# Altium schematic sheet DSP-Sheet-2.SchDoc
size A4; SheetNumber: 5; SheetTotal: 8
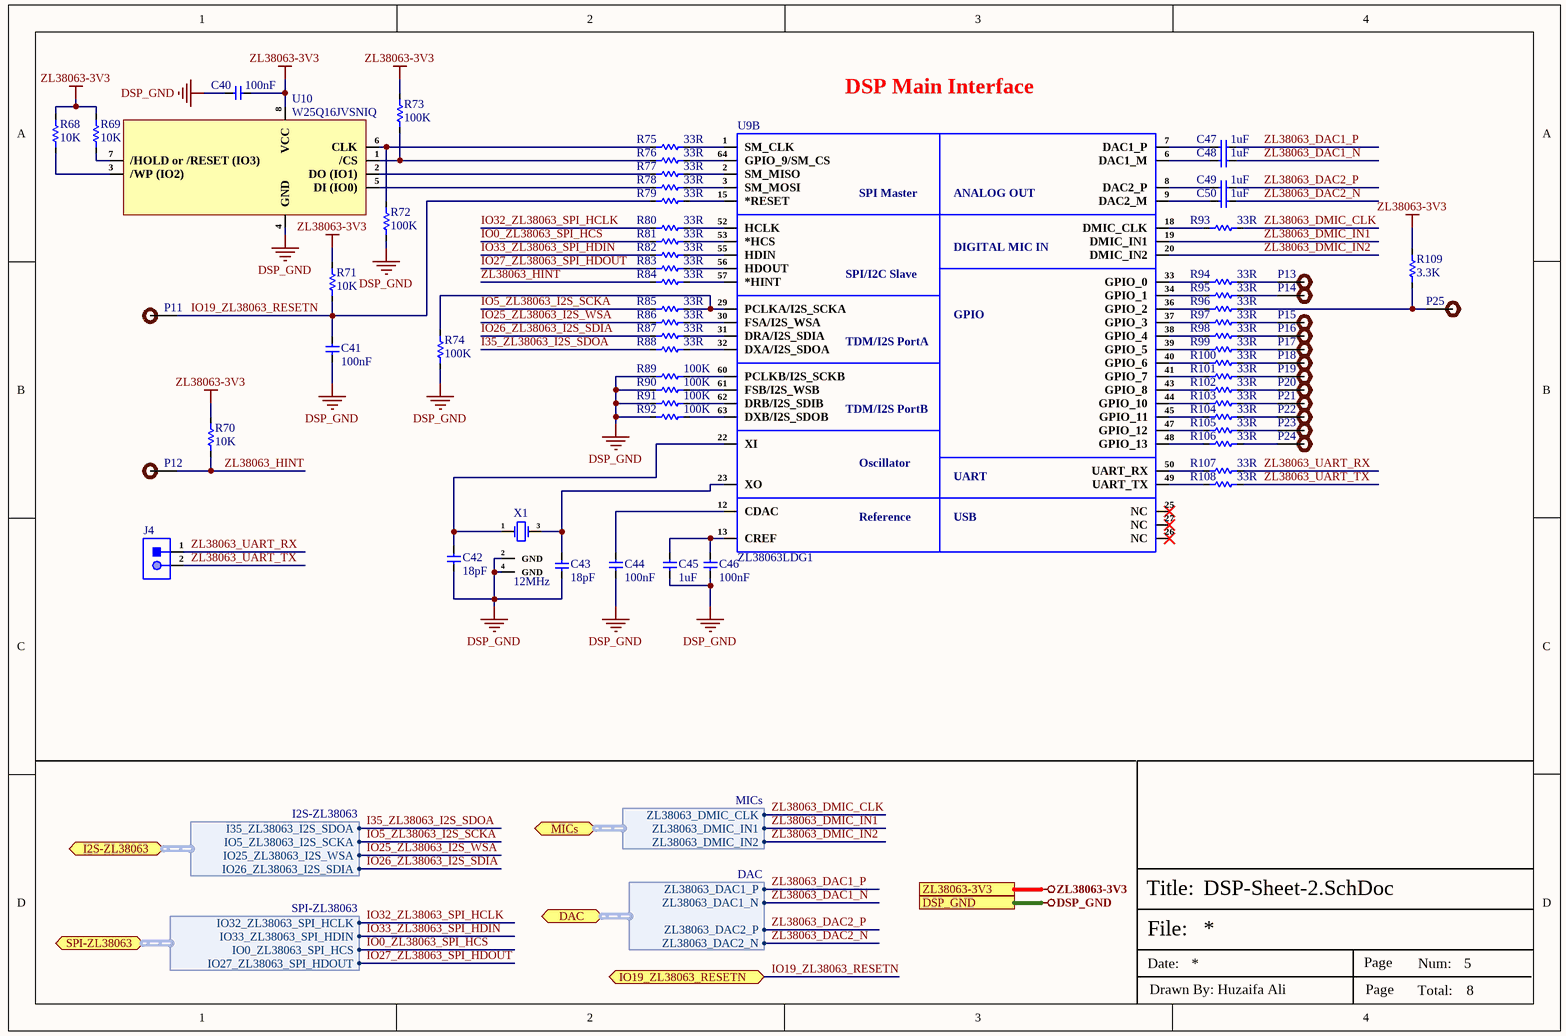
[diagram p0: DSP-Sheet-2.SchDoc]

## Parts
C40  100nF  [Cap-0402]
C41  100nF  [Cap-0402]
C42  18pF  [Cap-0603]
C43  18pF  [Cap-0603]
C44  100nF  [Cap-0402]
C45  1uF  [Cap-0402]
C46  100nF  [Cap-0402]
C47  1uF  [Cap-0402]
C48  1uF  [Cap-0402]
C49  1uF  [Cap-0402]
C50  1uF  [Cap-0402]
J4  X6511WV-02H-C60D30  [HDR1X2_]  (value not drawn)
P11  TEST POINT  [Test-point]  (value not drawn)
P12  TEST POINT  [Test-point]  (value not drawn)
P13  TEST POINT  [Test-point]  (value not drawn)
P14  TEST POINT  [Test-point]  (value not drawn)
P15  TEST POINT  [Test-point]  (value not drawn)
P16  TEST POINT  [Test-point]  (value not drawn)
P17  TEST POINT  [Test-point]  (value not drawn)
P18  TEST POINT  [Test-point]  (value not drawn)
P19  TEST POINT  [Test-point]  (value not drawn)
P20  TEST POINT  [Test-point]  (value not drawn)
P21  TEST POINT  [Test-point]  (value not drawn)
P22  TEST POINT  [Test-point]  (value not drawn)
P23  TEST POINT  [Test-point]  (value not drawn)
P24  TEST POINT  [Test-point]  (value not drawn)
P25  TEST POINT  [Test-point]  (value not drawn)
R68  10K  [Res-0402]
R69  10K  [Res-0402]
R70  10K  [Res-0402]
R71  10K  [Res-0402]
R72  100K  [Res-0402]
R73  100K  [Res-0402]
R74  100K  [Res-0402]
R75  33R  [Res-0201]
R76  33R  [Res-0201]
R77  33R  [Res-0201]
R78  33R  [Res-0201]
R79  33R  [Res-0201]
R80  33R  [Res-0201]
R81  33R  [Res-0201]
R82  33R  [Res-0201]
R83  33R  [Res-0201]
R84  33R  [Res-0201]
R85  33R  [Res-0201]
R86  33R  [Res-0201]
R87  33R  [Res-0201]
R88  33R  [Res-0201]
R89  100K  [Res-0402]
R90  100K  [Res-0402]
R91  100K  [Res-0402]
R92  100K  [Res-0402]
R93  33R  [Res-0201]
R94  33R  [Res-0201]
R95  33R  [Res-0201]
R96  33R  [Res-0201]
R97  33R  [Res-0201]
R98  33R  [Res-0201]
R99  33R  [Res-0201]
R100  33R  [Res-0201]
R101  33R  [Res-0201]
R102  33R  [Res-0201]
R103  33R  [Res-0201]
R104  33R  [Res-0201]
R105  33R  [Res-0201]
R106  33R  [Res-0201]
R107  33R  [Res-0201]
R108  33R  [Res-0201]
R109  3.3K  [Res-0201]
U9  ZL38063LDG1  [QFN-64-EP(9x9)]  (part B of 2)
U10  W25Q16JVSNIQ  [SOP-8]
X1  12MHz  [SMD2520-4P]

## Ports
DAC (bidir, harness DAC, see Amplifier-Sheet[1D], Buttons-LED-Sheet[1D]), DSP_GND (see DSP-Sheet-1[3D], Power-Sheet[2D]), I2S-ZL38063 (bidir, harness I2S-ZL38063, see Controller-Sheet[1D]), IO19_ZL38063_RESETN (bidir, see Controller-Sheet[3D]), MICs (bidir, harness MICs, see MICs-Sheet[1D]), SPI-ZL38063 (bidir, harness SPI-ZL38063, see Controller-Sheet[1D]), ZL38063-3V3 (see DSP-Sheet-1[3D], MICs-Sheet[3D], Power-Sheet[2D])

## Harnesses
I2S-ZL38063: I35_ZL38063_I2S_SDOA, IO5_ZL38063_I2S_SCKA, IO25_ZL38063_I2S_WSA, IO26_ZL38063_I2S_SDIA
SPI-ZL38063: IO32_ZL38063_SPI_HCLK, IO33_ZL38063_SPI_HDIN, IO0_ZL38063_SPI_HCS, IO27_ZL38063_SPI_HDOUT
MICs: ZL38063_DMIC_CLK, ZL38063_DMIC_IN1, ZL38063_DMIC_IN2
DAC: ZL38063_DAC1_P, ZL38063_DAC1_N, ZL38063_DAC2_P, ZL38063_DAC2_N

## Nets
DSP_GND: C40.2 C41.2 C42.1 C43.1 C44.2 C45.2 C46.2 R72.1 R74.1 R89.2 R90.2 R91.2 R92.2 U10.4(GND) X1.2(GND) X1.4(GND) ; port DSP_GND
ZL38063-3V3: C40.1 R68.2 R69.2 R70.2 R71.2 R73.2 R109.2 U10.8(VCC) ; port ZL38063-3V3
I35_ZL38063_I2S_SDOA: R88.1 ; port I2S-ZL38063.I35_ZL38063_I2S_SDOA
IO0_ZL38063_SPI_HCS: R81.1 ; port SPI-ZL38063.IO0_ZL38063_SPI_HCS
IO5_ZL38063_I2S_SCKA: R85.1 ; port I2S-ZL38063.IO5_ZL38063_I2S_SCKA
IO19_ZL38063_RESETN: C41.1 P11.1 R71.1 R79.1 ; port IO19_ZL38063_RESETN
IO25_ZL38063_I2S_WSA: R86.1 ; port I2S-ZL38063.IO25_ZL38063_I2S_WSA
IO26_ZL38063_I2S_SDIA: R87.1 ; port I2S-ZL38063.IO26_ZL38063_I2S_SDIA
IO27_ZL38063_SPI_HDOUT: R83.1 ; port SPI-ZL38063.IO27_ZL38063_SPI_HDOUT
IO32_ZL38063_SPI_HCLK: R80.1 ; port SPI-ZL38063.IO32_ZL38063_SPI_HCLK
IO33_ZL38063_SPI_HDIN: R82.1 ; port SPI-ZL38063.IO33_ZL38063_SPI_HDIN
ZL38063_DAC1_N: C48.1 ; port DAC.ZL38063_DAC1_N
ZL38063_DAC1_P: C47.1 ; port DAC.ZL38063_DAC1_P
ZL38063_DAC2_N: C50.1 ; port DAC.ZL38063_DAC2_N
ZL38063_DAC2_P: C49.1 ; port DAC.ZL38063_DAC2_P
ZL38063_DMIC_CLK: R93.2 ; port MICs.ZL38063_DMIC_CLK
ZL38063_DMIC_IN1: U9.19(DMIC_IN1) ; port MICs.ZL38063_DMIC_IN1
ZL38063_DMIC_IN2: U9.20(DMIC_IN2) ; port MICs.ZL38063_DMIC_IN2
ZL38063_HINT: P12.1 R70.1 R84.1
ZL38063_UART_RX: J4.1 R107.2
ZL38063_UART_TX: J4.2 R108.2
NetC42_2: C42.2 U9.22(XI) X1.1(OSC1)
NetC43_2: C43.2 U9.23(XO) X1.3(OSC2)
NetC44_1: C44.1 U9.12(CDAC)
NetC45_1: C45.1 C46.1 U9.13(CREF)
NetC47_2: C47.2 U9.7(DAC1_P)
NetC48_2: C48.2 U9.6(DAC1_M)
NetC49_2: C49.2 U9.8(DAC2_P)
NetC50_2: C50.2 U9.9(DAC2_M)
NetP13_1: P13.1 R94.2
NetP14_1: P14.1 R95.2
NetP15_1: P15.1 R97.2
NetP16_1: P16.1 R98.2
NetP17_1: P17.1 R99.2
NetP18_1: P18.1 R100.2
NetP19_1: P19.1 R101.2
NetP20_1: P20.1 R102.2
NetP21_1: P21.1 R103.2
NetP22_1: P22.1 R104.2
NetP23_1: P23.1 R105.2
NetP24_1: P24.1 R106.2
NetP25_1: P25.1 R96.2 R109.1
NetR68_1: R68.1 U10.3(/WP_(IO2))
NetR69_1: R69.1 U10.7(/HOLD_or_/RESET_(IO3))
NetR72_2: R72.2 R75.1 U10.6(CLK)
NetR73_1: R73.1 R76.1 U10.1(/CS)
NetR74_2: R74.2 R85.2 U9.29(PCLKA/I2S_SCKA)
NetR75_2: R75.2 U9.1(SM_CLK)
NetR76_2: R76.2 U9.64(GPIO_9/SM_CS)
NetR77_1: R77.1 U10.2(DO_(IO1))
NetR77_2: R77.2 U9.2(SM_MISO)
NetR78_1: R78.1 U10.5(DI_(IO0))
NetR78_2: R78.2 U9.3(SM_MOSI)
NetR79_2: R79.2 U9.15(*RESET)
NetR80_2: R80.2 U9.52(HCLK)
NetR81_2: R81.2 U9.53(*HCS)
NetR82_2: R82.2 U9.55(HDIN)
NetR83_2: R83.2 U9.56(HDOUT)
NetR84_2: R84.2 U9.57(*HINT)
NetR86_2: R86.2 U9.30(FSA/I2S_WSA)
NetR87_2: R87.2 U9.31(DRA/I2S_SDIA)
NetR88_2: R88.2 U9.32(DXA/I2S_SDOA)
NetR89_1: R89.1 U9.60(PCLKB/I2S_SCKB)
NetR90_1: R90.1 U9.61(FSB/I2S_WSB)
NetR91_1: R91.1 U9.62(DRB/I2S_SDIB)
NetR92_1: R92.1 U9.63(DXB/I2S_SDOB)
NetR93_1: R93.1 U9.18(DMIC_CLK)
NetR94_1: R94.1 U9.33(GPIO_0)
NetR95_1: R95.1 U9.34(GPIO_1)
NetR96_1: R96.1 U9.36(GPIO_2)
NetR97_1: R97.1 U9.37(GPIO_3)
NetR98_1: R98.1 U9.38(GPIO_4)
NetR99_1: R99.1 U9.39(GPIO_5)
NetR100_1: R100.1 U9.40(GPIO_6)
NetR101_1: R101.1 U9.41(GPIO_7)
NetR102_1: R102.1 U9.43(GPIO_8)
NetR103_1: R103.1 U9.44(GPIO_10)
NetR104_1: R104.1 U9.45(GPIO_11)
NetR105_1: R105.1 U9.47(GPIO_12)
NetR106_1: R106.1 U9.48(GPIO_13)
NetR107_1: R107.1 U9.50(UART_RX)
NetR108_1: R108.1 U9.49(UART_TX)

Not connected (* = marked no-connect by the designer): U9 25(NC)* 26(NC)* 27(NC)*

## Notes on the sheet
- (near U9) DSP Main Interface
- File:
- Title:
- Date:
- Page
- Num:
- Total:
- Drawn By: Huzaifa Ali
- (in symbol ZL38063LDG1, part B) SPI Master; ANALOG OUT; DIGITAL MIC IN; SPI/I2C Slave; GPIO; TDM/I2S PortA; TDM/I2S PortB; Oscillator; UART; Reference; USB

## Library data of the parts
C40 C41 C44 C46 = CC0402KRX5R7BB104: CAP CER 0.1UF 16V X5R 0402; Manufacturer: Yageo; Tolerance: 10%; Supplier 1: Mouser; Manufacturer Part Number: CC0402KRX5R7BB104; RoHS: Yes; Category: Ceramic Capacitors; Stock 1: 936792; Pricing 1: 1=0.10000, 10=0.02300, 50=0.02300, 100=0.01100, 1000=0.00600, 10000=0.00400 (USD); Mount: Surface Mount; Case/Package: 0402; Number of Pins: 2; Case Code (Metric): 1005; Case Code (Imperial): 0402; Min Operating Temperature: -55°C; Max Operating Temperature: 85°C; Capacitance: 100nF; Dielectric: X5R; Packaging: Tape and Reel; Voltage Rating: 16V; Package Quantity: 1; Voltage Rating (DC): 16V; Termination: SMD/SMT; Resistor Type: Ceramic; Series: CC; Construction: Flat; Length: 1mm; Width: 0.02inch; Height: 0.5mm; Thickness: 0.022inch; Depth: 0.5mm; Radiation Hardening: No; REACH SVHC: Unknown; Lead Free: Lead Free; Halogen Free: Halogen Free; RoHS Compliant: Yes; ComponentLink1URL: https://datasheet.ciiva.com/155/mlccorderingcode-155879.pdf?src-supplier=Digi-Key; ComponentLink1Description: https://datasheet.ciiva.com/155/mlccorderingcode-155879.pdf?src-supplier=Digi-Key; ComponentLink2URL: https://datasheet.ciiva.com/155/mlccorderingcode-155878.pdf?src-supplier=Digi-Key; ComponentLink2Description: https://datasheet.ciiva.com/155/mlccorderingcode-155878.pdf?src-supplier=Digi-Key; ComponentLink3URL: https://datasheet.ciiva.com/155/mlccorderingcode-155880.pdf?src-supplier=Digi-Key; ComponentLink3Description: https://datasheet.ciiva.com/155/mlccorderingcode-155880.pdf?src-supplier=Digi-Key; ComponentLink4URL: https://datasheet.ciiva.com/11464/upy-gphc-x5r-4v-to-50v-12-11464869.pdf?src-supplier=Avnet; ComponentLink4Description: https://datasheet.ciiva.com/11464/upy-gphc-x5r-4v-to-50v-12-11464869.pdf?src-supplier=Avnet; Supplier Part Number 1: 603-CC402KRX5R7BB104; LCSC Part Number: C106204
C42 C43 = CC0603JRNPO9BN180: CAP CER 18PF 50V C0G/NPO 0603; Manufacturer: Yageo; Tolerance: 5%; Dielectric: C0G; Temperature Coefficient: 30ppm/°C; Insulation Resistance: 100GR; Supplier 1: Digi-Key; Manufacturer Part Number: CC0603JRNPO9BN180; RoHS: Yes; Category: Ceramic Capacitors; Stock 1: 936645; Pricing 1: 1=0.10000, 10=0.04000, 50=0.02200, 100=0.01790, 500=0.01282, 1000=0.01007 (USD); Mount: Surface Mount; Case/Package: 0603; Number of Pins: 2; Case Code (Metric): 1608; Case Code (Imperial): 0603; Min Operating Temperature: -55°C; Max Operating Temperature: 125°C; Capacitance: 18pF; Packaging: Tape and Reel; Voltage Rating: 50V; Voltage Rating (DC): 50V; Package Quantity: 1; Termination: SMD/SMT; Resistor Type: Ceramic; Series: CC; Length: 1.6mm; Width: 0.031inch; Height: 0.8mm; Thickness: 0.035inch; Depth: 0.8mm; Radiation Hardening: No; REACH SVHC: No SVHC; Lead Free: Lead Free; RoHS Compliant: Yes; ComponentLink1URL: https://datasheet.ciiva.com/144/mlccorderingcode-144638.pdf?src-supplier=Digi-Key; ComponentLink1Description: https://datasheet.ciiva.com/144/mlccorderingcode-144638.pdf?src-supplier=Digi-Key; ComponentLink2URL: https://datasheet.ciiva.com/144/mlccorderingcode-144637.pdf?src-supplier=Digi-Key; ComponentLink2Description: https://datasheet.ciiva.com/144/mlccorderingcode-144637.pdf?src-supplier=Digi-Key; ComponentLink3URL: https://datasheet.ciiva.com/144/mlccorderingcode-144639.pdf?src-supplier=Digi-Key; ComponentLink3Description: https://datasheet.ciiva.com/144/mlccorderingcode-144639.pdf?src-supplier=Digi-Key; ComponentLink4URL: https://datasheet.ciiva.com/28450/1443161-28450477.pdf?src-supplier=Element14; ComponentLink4Description: https://datasheet.ciiva.com/28450/1443161-28450477.pdf?src-supplier=Element14; ComponentLink5URL: https://datasheet.ciiva.com/46430/1835847-46430152.pdf?src-supplier=Element14; ComponentLink5Description: https://datasheet.ciiva.com/46430/1835847-46430152.pdf?src-supplier=Element14; ComponentLink6URL: https://datasheet.ciiva.com/5425/upy-gp-np0-16v-to-50v-8-5425439.pdf?src-supplier=Mouser; ComponentLink6Description: https://datasheet.ciiva.com/5425/upy-gp-np0-16v-to-50v-8-5425439.pdf?src-supplier=Mouser; ComponentLink7URL: https://datasheet.ciiva.com/8033/1734582-8033733.pdf?src-supplier=Element14; ComponentLink7Description: https://datasheet.ciiva.com/8033/1734582-8033733.pdf?src-supplier=Element14; ComponentLink8URL: https://datasheet.ciiva.com/11587/upy-gp-np0-16v-to-50v-8-11587323.pdf?src-supplier=Avnet; ComponentLink8Description: https://datasheet.ciiva.com/11587/upy-gp-np0-16v-to-50v-8-11587323.pdf?src-supplier=Avnet; Supplier Part Number 1: 311-1061-6-ND; LCSC Part Number: C107040
C45 C47-C50 = CC0402KRX5R8BB105: CAP CER 1UF 25V X5R 0402; Manufacturer: Yageo; Tolerance: 10%; Supplier 1: Mouser; Manufacturer Part Number: CC0402KRX5R8BB105; RoHS: Yes; Category: Ceramic Capacitors; Stock 1: 91975; Pricing 1: 1=0.30000, 10=0.20400, 50=0.20400, 100=0.11600, 1000=0.07200, 10000=0.05900 (USD); Mount: Surface Mount; Case/Package: 0402; Case Code (Metric): 1005; Case Code (Imperial): 0402; Weight: 2.3E-05oz; Min Operating Temperature: -55°C; Max Operating Temperature: 85°C; Packaging: Tape and Reel; Capacitance: 1uF; Voltage Rating: 25V; Dielectric: X5R; Termination: SMD/SMT; Voltage Rating (DC): 25V; Package Quantity: 10000; Length: 0.039inch; Width: 0.02inch; Thickness: 0.022inch; Lead Free: Lead Free; Halogen Free: Halogen Free; RoHS Compliant: Yes; ComponentLink1URL: http://www.mouser.com/ds/2/447/Yageo_UPY-GP_NP0_16V-to-50V_9-358835.pdf?src-supplier=Mouser; ComponentLink1Description: http://www.mouser.com/ds/2/447/Yageo_UPY-GP_NP0_16V-to-50V_9-358835.pdf?src-supplier=Mouser; ComponentLink2URL: http://www.yageo.com/documents/recent/UPY-GPHC_X5R_4V-to-50V_25.pdf?src-supplier=Digi-Key; ComponentLink2Description: http://www.yageo.com/documents/recent/UPY-GPHC_X5R_4V-to-50V_25.pdf?src-supplier=Digi-Key; ComponentLink3URL: https://4donline.ihs.com/images/VipMasterIC/IC/YAGO/YAGO-S-A0006851646/YAGO-S-A0006851646-1.pdf?hkey=6D3A4C79FDBF58556ACFDE234799DDF0&src-supplier=Newark; ComponentLink3Description: https://4donline.ihs.com/images/VipMasterIC/IC/YAGO/YAGO-S-A0006851646/YAGO-S-A0006851646-1.pdf?hkey=6D3A4C79FDBF58556ACFDE234799DDF0&src-supplier=Newark; Supplier Part Number 1: 603-CC402KRX5R8BB105; LCSC Part Number: C326568
J4 = X6511WV-02H-C60D30: Gold 250V 3A Straight Square Pins 2.5mm 2P 260℃ 6mm -40℃~+105℃ 3mm 2.54mm Plugin Black Brass 1x2P Plugin,P=2.54mm Pin Headers ROHS; Manufacturer: XKB; Item Type: Male Header; Manufacturer Part Number: X6511WV-02H-C60D30; Package: Plugin,P=2.54mm; LCSC Part Number: C706874; ComponentLink1Description: LCSC; ComponentLink1URL: https://www.lcsc.com/product-detail/Pin-Headers_XKB-Connectivity-X6511WV-02H-C60D30_C706874.html
P11-P25 = TEST POINT: Test Point ON; Item Type: TEST POINT
R68-R71 = RC0402FR-0710KL: RES 10K OHM 1% 1/16W 0402; Manufacturer: Yageo; Resistance: 10kR; Voltage Rating (DC): 50V; Temperature Coefficient: 100ppm/°C; Power Rating: 62.5mW; Max Power Dissipation: 63mW; Item Type: Resistor; Supplier 1: Mouser; Manufacturer Part Number: RC0402FR-0710KL; RoHS: Yes; Category: Chip SMD Resistors; Stock 1: 18648329; Pricing 1: 1=0.10000, 10=0.01400, 50=0.01400, 100=0.00500, 1000=0.00300, 10000=0.00200 (USD); Case/Package: 0402; Number of Pins: 2; Case Code (Imperial): 0402; Case Code (Metric): 1005; Min Operating Temperature: -55°C; Max Operating Temperature: 155°C; Resistor Type: Thick Film; Tolerance: 1%; Packaging: Tape and Reel; Voltage Rating: 50V; Termination: SMD/SMT; Working Voltage: 50V; Number of Terminations: 2; Features: Moisture Resistant; Series: RC; Resistance Tolerance: 1%; Construction: Rectangular; Length: 1mm; Width: 0.5mm; Height: 0.32mm; Depth: 0.5mm; Lead Pitch: 0.2mm; REACH SVHC: No SVHC; Lead Free: Lead Free; RoHS Compliant: Yes; Military Standard: Not; ComponentLink1URL: https://datasheet.ciiva.com/7660/38568-7660787.pdf?src-supplier=Element14; ComponentLink1Description: https://datasheet.ciiva.com/7660/38568-7660787.pdf?src-supplier=Element14; ComponentLink2URL: https://datasheet.ciiva.com/7849/1686128-7849814.pdf?src-supplier=Element14; ComponentLink2Description: https://datasheet.ciiva.com/7849/1686128-7849814.pdf?src-supplier=Element14; ComponentLink3URL: https://datasheet.ciiva.com/7983/1018594-7983486.pdf?src-supplier=Element14; ComponentLink3Description: https://datasheet.ciiva.com/7983/1018594-7983486.pdf?src-supplier=Element14; ComponentLink4URL: https://datasheet.ciiva.com/22747/1018594-22747512.pdf?src-supplier=Element14; ComponentLink4Description: https://datasheet.ciiva.com/22747/1018594-22747512.pdf?src-supplier=Element14; ComponentLink5URL: https://datasheet.ciiva.com/12667/pyu-rc0402-51-rohs-l-6-r-12667067.pdf?src-supplier=Mouser; ComponentLink5Description: https://datasheet.ciiva.com/12667/pyu-rc0402-51-rohs-l-6-r-12667067.pdf?src-supplier=Mouser; ComponentLink6URL: https://datasheet.ciiva.com/7849/1784430-7849813.pdf?src-supplier=Element14; ComponentLink6Description: https://datasheet.ciiva.com/7849/1784430-7849813.pdf?src-supplier=Element14; ComponentLink7URL: https://datasheet.ciiva.com/7849/1784430-7849815.pdf?src-supplier=Element14; ComponentLink7Description: https://datasheet.ciiva.com/7849/1784430-7849815.pdf?src-supplier=Element14; Supplier Part Number 1: 603-RC0402FR-0710KL; LCSC Part Number: C60490
R72-R74 R89-R92 = RC0402FR-07100KL: RES 100K OHM 1% 1/16W 0402; Manufacturer: Yageo; Resistance: 100kR; Temperature Coefficient: 100ppm/°C; Power Rating: 63mW; Voltage Rating: 50V; Item Type: Resistor; Supplier 1: Mouser; Manufacturer Part Number: RC0402FR-07100KL; RoHS: Yes; Category: Chip SMD Resistors; Stock 1: 7759549; Pricing 1: 1=0.10000, 10=0.01200, 50=0.01200, 100=0.00500, 1000=0.00300, 2500=0.00200, 10000=0.00100 (USD); Case/Package: 0402; Case Code (Metric): 1005; Case Code (Imperial): 0402; Min Operating Temperature: -55°C; Max Operating Temperature: 155°C; Resistor Type: Thick Film; Tolerance: 1%; Packaging: Tape and Reel; Package Quantity: 1; Number of Terminations: 2; Termination: SMD/SMT; Max Power Dissipation: 63mW; Working Voltage: 50V; Features: Moisture Resistant; Series: RC; Resistance Tolerance: 1%; Construction: Rectangular; Technology: THICK FILM; Length: 0.039inch; Width: 0.02inch; Height: 0.016inch; Depth: 0.5mm; REACH SVHC: No SVHC; Lead Free: Lead Free; RoHS Compliant: Yes; Military Standard: Not; ComponentLink1URL: https://datasheet.ciiva.com/11819/0900766b80c66297-11819452.pdf?src-supplier=RSComponents; ComponentLink1Description: https://datasheet.ciiva.com/11819/0900766b80c66297-11819452.pdf?src-supplier=RSComponents; ComponentLink2URL: https://datasheet.ciiva.com/22747/1018594-22747509.pdf?src-supplier=Element14; ComponentLink2Description: https://datasheet.ciiva.com/22747/1018594-22747509.pdf?src-supplier=Element14; ComponentLink3URL: https://datasheet.ciiva.com/2453/pyu-r-int-thick-7-2453362.pdf?src-supplier=Digi-Key; ComponentLink3Description: https://datasheet.ciiva.com/2453/pyu-r-int-thick-7-2453362.pdf?src-supplier=Digi-Key; ComponentLink4URL: https://datasheet.ciiva.com/2453/pyu-r-int-thick-7-2453363.pdf?src-supplier=Digi-Key; ComponentLink4Description: https://datasheet.ciiva.com/2453/pyu-r-int-thick-7-2453363.pdf?src-supplier=Digi-Key; ComponentLink5URL: https://datasheet.ciiva.com/2453/pyu-r-int-thick-7-2453361.pdf?src-supplier=Digi-Key; ComponentLink5Description: https://datasheet.ciiva.com/2453/pyu-r-int-thick-7-2453361.pdf?src-supplier=Digi-Key; ComponentLink6URL: https://datasheet.ciiva.com/12667/pyu-rc0402-51-rohs-l-6-r-12667930.pdf?src-supplier=Mouser; ComponentLink6Description: https://datasheet.ciiva.com/12667/pyu-rc0402-51-rohs-l-6-r-12667930.pdf?src-supplier=Mouser; ComponentLink7URL: https://datasheet.ciiva.com/15189/getdatasheetpartid-323696-15189334.pdf?src-supplier=Verical; ComponentLink7Description: https://datasheet.ciiva.com/15189/getdatasheetpartid-323696-15189334.pdf?src-supplier=Verical; Supplier Part Number 1: 603-RC0402FR-07100KL; LCSC Part Number: C60491
R75-R88 R93-R108 = RC0201FR-0733RL: RES 33 OHM 1% 1/20W 0201; Manufacturer: Yageo; Item Type: Resistor; Supplier: Future Electronics; Supplier Part Number: 6199285; Manufacturer Part Number: RC0201FR-0733RL; RoHS: Yes; Category: Chip SMD Resistors; Stock: 1420000; Pricing: 10000=0.0013, 50000=0.0012, 250000=0.0012, 750000=0.0011, 2000000=0.001 (USD); ComponentLink1URL: https://datasheet.ciiva.com/2560/pyu-r-int-thick-7-2560877.pdf?src-supplier=Digi-Key; ComponentLink1Description: https://datasheet.ciiva.com/2560/pyu-r-int-thick-7-2560877.pdf?src-supplier=Digi-Key; ComponentLink2URL: https://datasheet.ciiva.com/2560/pyu-r-int-thick-7-2560878.pdf?src-supplier=Digi-Key; ComponentLink2Description: https://datasheet.ciiva.com/2560/pyu-r-int-thick-7-2560878.pdf?src-supplier=Digi-Key; ComponentLink3URL: https://datasheet.ciiva.com/2560/pyu-r-int-thick-7-2560879.pdf?src-supplier=Digi-Key; ComponentLink3Description: https://datasheet.ciiva.com/2560/pyu-r-int-thick-7-2560879.pdf?src-supplier=Digi-Key; ComponentLink4URL: https://datasheet.ciiva.com/7672/1563626-7672223.pdf?src-supplier=Element14; ComponentLink4Description: https://datasheet.ciiva.com/7672/1563626-7672223.pdf?src-supplier=Element14; ComponentLink5URL: https://datasheet.ciiva.com/22698/1563626-22698520.pdf?src-supplier=Element14; ComponentLink5Description: https://datasheet.ciiva.com/22698/1563626-22698520.pdf?src-supplier=Element14; LCSC Part Number: C295794
R109 = RC0201FR-073K3L: RES 3.3K OHM 1% 1/20W 0201; Manufacturer: Yageo; Item Type: Resistor; Supplier: Future Electronics; Supplier Part Number: 1068525; Manufacturer Part Number: RC0201FR-073K3L; RoHS: Yes; Category: Chip SMD Resistors; Stock: 40000; Pricing: 10000=0.0009, 50000=0.0013, 100000=0.0008, 250000=0.0013, 400000=0.0008, 750000=0.0012, 1500000=0.0007, 2000000=0.0011, 5000000=0.0007 (USD); ComponentLink1URL: https://datasheet.ciiva.com/14985/pyu-r-int-thick-7-14985418.pdf?src-supplier=Digi-Key; ComponentLink1Description: https://datasheet.ciiva.com/14985/pyu-r-int-thick-7-14985418.pdf?src-supplier=Digi-Key; ComponentLink2URL: https://datasheet.ciiva.com/22698/1563626-22698524.pdf?src-supplier=Element14; ComponentLink2Description: https://datasheet.ciiva.com/22698/1563626-22698524.pdf?src-supplier=Element14; LCSC Part Number: C274874
U9 = ZL38063LDG1: IC AUDIO SIGNAL PROCESSOR 64QFN; Manufacturer: Microchip; Supplier: Digi-Key; Supplier Part Number: ZL38063LDG1-ND; Manufacturer Part Number: ZL38063LDG1; RoHS: Yes; Category: Integrated Circuits (ICs); Stock: 1300; Pricing: 1=8.2, 25=7.55, 100=7.175 (USD); ComponentLink1URL: https://www.microsemi.com/document-portal/doc_download/136798-zl38063-datasheet?src-supplier=Digi-Key; ComponentLink1Description: https://www.microsemi.com/document-portal/doc_download/136798-zl38063-datasheet?src-supplier=Digi-Key; LCSC Part Number: C1535597; Item Type: IC
U10 = W25Q16JVSNIQ: IC FLASH 16MBIT SPI/QUAD 8SOIC; Manufacturer: Winbond; Memory Format: Non-Volatile,FLASH,NOR; Memory Size: 16Mb; Frequency: 133MHz; Interface: SPI,Serial; Page Size: 256B; Min Supply Voltage: 2.7V; Max Supply Voltage: 3.6V; Access Time-Max: 6ns; Supplier: Digi-Key; Supplier Part Number: W25Q16JVSNIQ-ND; Manufacturer Part Number: W25Q16JVSNIQ; RoHS: Yes; Category: Flash; Stock: 181191; Pricing: 1=0.5, 25=0.4528, 100=0.3969, 500=0.38024, 2500=0.34104 (USD); Mounting Technology: Surface Mount; Case/Package: SOIC; Pins: 8; Min Operating Temperature: -40°C; Max Operating Temperature: 85°C; Packaging: Rail/Tube; Series: SpiFlash®; RoHS Compliant: Yes; ComponentLink1URL: https://datasheet.ciiva.com/56373/w25q16jvspirevg03222018plus-56373878.pdf?src-supplier=Digi-Key; ComponentLink1Description: https://datasheet.ciiva.com/56373/w25q16jvspirevg03222018plus-56373878.pdf?src-supplier=Digi-Key; LCSC Part Number: C2456211; Item Type: IC
X1 = 2TJ412000XYGBC: 12MHz 18pF ±10ppm SMD2520-4P Crystals ROHS; Manufacturer: JYJE; Manufacturer Part Number: 2TJ412000XYGBC; Package: SMD2520-4P; LCSC Part Number: C2149207; Item Type: Crystal; ComponentLink1Description: LCSC; ComponentLink1URL: https://www.lcsc.com/product-detail/Crystals_JYJE-2TJ412000XYGBC_C2149207.html